# Altium schematic sheet K-Line.SchDoc
size A; Author: Jared Ainsworth; CompanyName: UpRev LLC; Engineer: Jared Ainsworth; Organization: UpRev LLC; Address1: 4807 Commercial Park Dr.; Address2: Austin, TX 78724; Address3: United States; Address4: www.UpRev.com; SheetNumber: 6; SheetTotal: 13
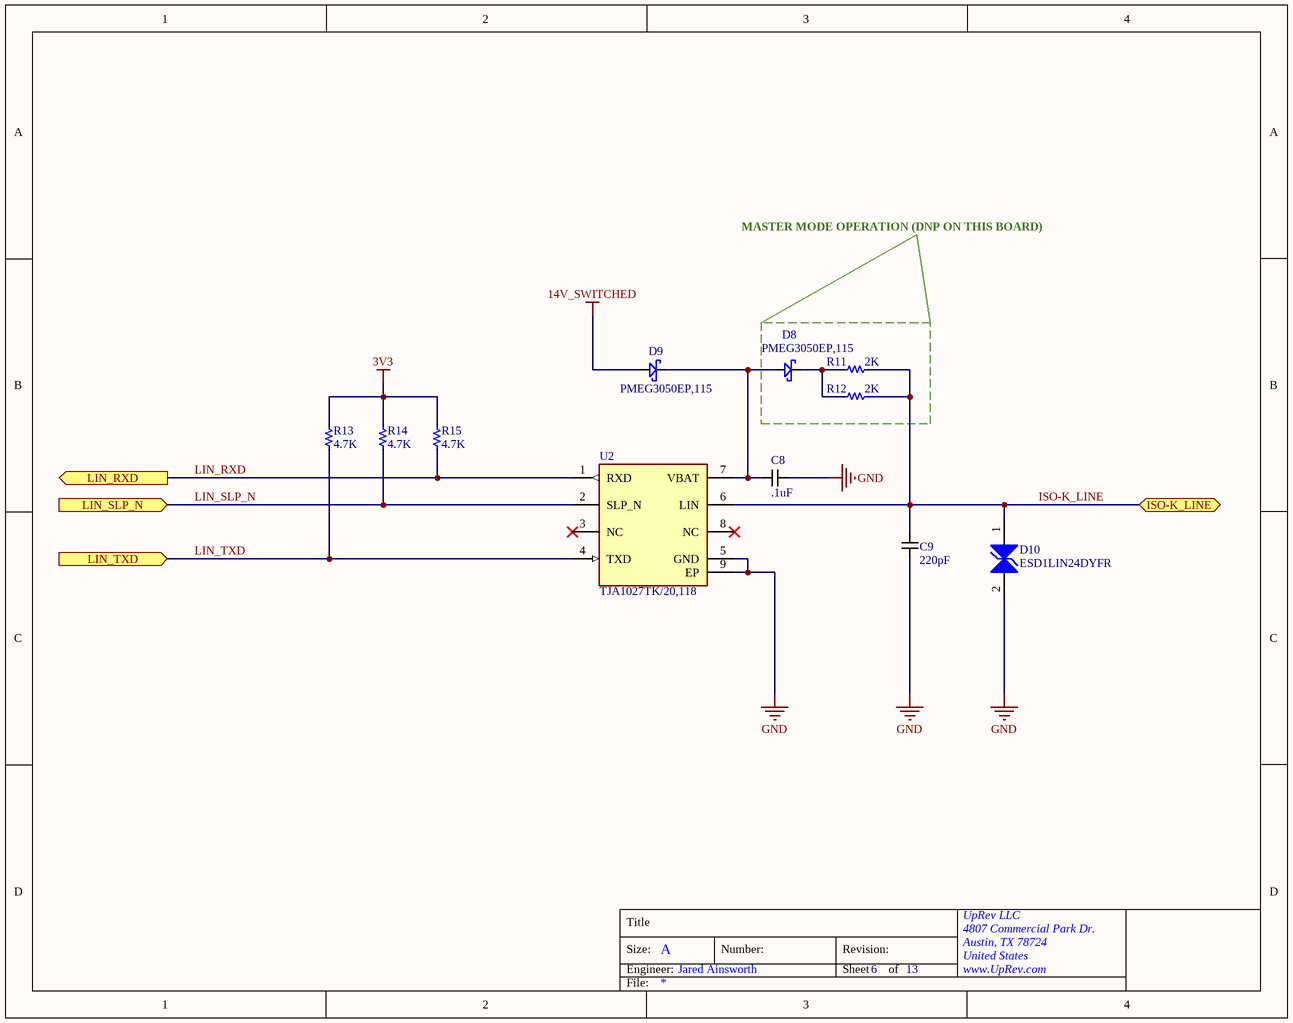
[diagram p0: K-Line.SchDoc]

## Parts
C8  .1uF  [C0603 (1608)]
C9  220pF  [C0603 (1608), TIGHT]
D8  PMEG3050EP,115  [SOD-128]
D9  PMEG3050EP,115  [SOD-128]
D10  3-PF 24-V 30-KV ESD PROTECTION D  [SOD-323_IPC_C]  (value not drawn)
R11  2K  [R0603 (1608)]
R12  2K  [R0603 (1608)]
R13  4.7K  [R0402 (1005)]
R14  4.7K  [R0402 (1005)]
R15  4.7K  [R0402 (1005)]
U2  IC TRANSCEIVER 1/1 8HVSON  [HVSON-8]  (value not drawn)

## Ports
ISO-K_LINE (bidir, see OBD_II_Connector[2B]), LIN_RXD (out, see OBD_II_Connector[2B], Dev_Board_Connection[3B], OBD_II_Connector[1B]), LIN_SLP_N (in, see OBD_II_Connector[2B], Dev_Board_Connection[2B], OBD_II_Connector[1B]), LIN_TXD (in, see OBD_II_Connector[2B], Dev_Board_Connection[2B], OBD_II_Connector[1B])

## Nets
3V3: R13.2 R14.2 R15.2
14V_SWITCHED: D9.2(Anode)
GND: C8.2 C9.2 D10.2(GND) U2.5(GND) U2.9(EP)
ISO-K_LINE: C9.1 D10.1(IO) R11.2 R12.2 U2.6(LIN) ; port ISO-K_LINE
LIN_RXD: R15.1 U2.1(RXD) ; port LIN_RXD
LIN_SLP_N: R14.1 U2.2(SLP_N) ; port LIN_SLP_N
LIN_TXD: R13.1 U2.4(TXD) ; port LIN_TXD
NetC8_1: C8.1 D8.2(Anode) D9.1(Cathode) U2.7(VBAT)
NetD8_1: D8.1(Cathode) R11.1 R12.1

Not connected (* = marked no-connect by the designer): U2 3(NC)* 8(NC)*

## Notes on the sheet
- MASTER MODE OPERATION (DNP ON THIS BOARD)
- Title
- Size:
- Engineer:
- A
- Number:
- Revision:
- Sheet
- of
- File:

## Library data of the parts
C8 = 100nF Ceramic, 25V, 0603 (1608): 100nF Ceramic Capacitor, 25V, X7R, ±10%, 0603 (1608); Manufacturer Part Number: CL10B104KA8NNNC; Manufacturer: Samsung Electro-Mechanics; Package: 0603 (1608 metric); LCSC Part Number: C1590; Value: .1uF
C9 = 220pF Ceramic, 100V, 0603 (1608): 220pF Ceramic, 100V, ±10%, X7R, 0603 (1608); Manufacturer Part Number: CL10B221KC85PNC; Manufacturer: Samsung Electro-Mechanics; Package: 0603 (1608 metric); Value: 220pF; LCSC Part Number: C16194548
D8 D9 = PMEG3050EP,115: Schottky Diode, 5A, 30V, SOD-128; Manufacturer: Nexperia; Package: SOD-128; LCSC Part Number: C50603; Manufacturer Part Number: PMEG3050EP,115
D10 = ESD1LIN24DYFR: 42V Clamp 4.3A (8/20µs) Ipp Tvs Diode Surface Mount SOD-323; Manufacturer: Texas Instruments; LCSC Part Number: C20345389; Package: SOD-323; Manufacturer Part Number: ESD1LIN24DYFR
R11 R12 = 2K ohm, 0603 (1608): 2K ohm, ±1%, 0603 (1608); Manufacturer: UNI-ROYAL(Uniroyal Elec); Manufacturer Part Number: 0603WAF2001T5E; Package: 0603 (1608 metric); LCSC Part Number: C22975; Value: 2K
R13-R15 = 4.7K ohm, 0402 (1005): 4.7K ohm, Resistor, ±1%, 0402 (1005); Manufacturer: UNI-ROYAL(Uniroyal Elec); Manufacturer Part Number: 0402WGF4701TCE; Package: 0402 (1005 metric); LCSC Part Number: C25900; Value: 4.7K
U2 = TJA1027TK/20,118: 1/1 Transceiver LINbus 8-HVSON (3x3); Manufacturer: NXP Semicon; LCSC Part Number: C194379; Package: HVSON-8-EP(3x3); Manufacturer Part Number: TJA1027TK/20,118